# Altium schematic sheet 实验项目三.SchDoc
size A4
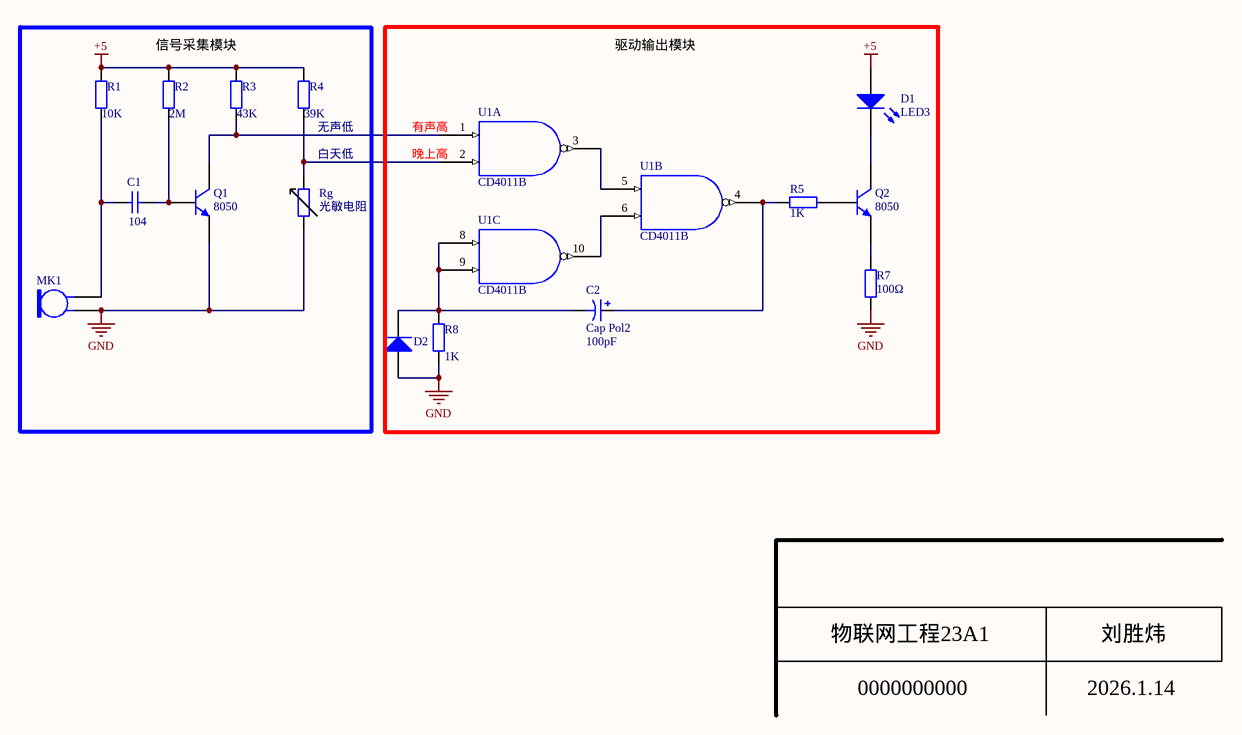
[diagram p0: 实验项目三.SchDoc]

## Parts
C1  value 104  [RAD-0.3]  (hidden comment: Cap)
C2  Cap Pol2  value 100pF  [POLAR0.8]
D1  LED3  [3.5X2.8X1.9]
D2  Diode  [SMC]  (value not drawn)
MK1  Mic2  [PIN2]  (value not drawn)
Q1  8050  [SOT-23B_N]
Q2  8050  [SOT-23B_N]
R1  value 10K  [AXIAL-0.4]  (hidden comment: Res2)
R2  value 2M  [AXIAL-0.4]  (hidden comment: Res2)
R3  value 43K  [AXIAL-0.4]  (hidden comment: Res2)
R4  value 39K  [AXIAL-0.4]  (hidden comment: Res2)
R5  value 1K  [AXIAL-0.4]  (hidden comment: Res2)
R7  value 100Ω  [AXIAL-0.4]  (hidden comment: Res2)
R8  value 1K  [AXIAL-0.4]  (hidden comment: Res2)
Rg  光敏电阻  [AXIAL-0.4]
U1  CD4011B  [DIP-14]  (parts A,B,C of 4)

## Blocks framed on the sheet
信号采集模块: C1 MK1 Q1 R1-R4 Rg
驱动输出模块: C2 D1 D2 Q2 R5 R7 R8 U1

## Nets
+5: D1.1(A) R1.2 R2.2 R3.2 R4.2
GND: D2.1(A) MK1.2 Q1.3(E) R7.2 R8.1 Rg.1 U1.7(GND)
VCC: U1.14(VCC)
NetC1_1: C1.1 MK1.1 R1.1
NetC1_2: C1.2 Q1.2(B) R2.1
NetC2_1: C2.1 R5.2 U1.4
NetC2_2: C2.2 D2.2(K) R8.2 U1.8 U1.9
NetD1_2: D1.2(K) Q2.1(C)
NetQ1_1: Q1.1(C) R3.1 U1.1
NetQ2_2: Q2.2(B) R5.1
NetQ2_3: Q2.3(E) R7.1
NetR4_1: R4.1 Rg.2 U1.2
NetU1_3: U1.3 U1.5
NetU1_6: U1.6 U1.10

## Notes on the sheet
- (near R4) 无声低
- 白天低
- (near U1) 有声高
- (near U1) 晚上高
- 物联网工程23A1
- 0000000000
- 2026.1.14
- 刘胜炜

## Library data of the parts
C1 = Cap: Capacitor; Published: 8-Jun-2000; LatestRevisionDate: 17-Jul-2002; LatestRevisionNote: Re-released for DXP Platform.; PackageReference: RAD-0.3; Publisher: Altium Limited; PackageDescription: Radial Cap, Thru-Hole; 2 Leads; 0.3 in Pin Spacing
C2 = Cap Pol2: Polarized Capacitor (Axial); Published: 8-Jun-2000; LatestRevisionDate: 17-Jul-2002; LatestRevisionNote: Re-released for DXP Platform.; PackageReference: POLAR0.8; Publisher: Altium Limited; PackageDescription: Polarized Capacitor; 2 Leads
D1 = LED3: Typical BLUE SiC LED; Published: 8-Jun-2000; LatestRevisionDate: 17-Dec-2003; LatestRevisionNote: PCB Footprint replaced.; DatasheetVersion: 16-Apr-2002; PackageVersion: 16-Apr-2002; PackageReference: 3.5X2.8X1.9; Publisher: Altium Limited; PackageDescription: SM LED; 2 C-Bend Leads; Body 3.5 x 2.8 x 1.9 mm, inc leads (LxWxH typ)
D2 = Diode: Default Diode; Published: 8-Jun-2000; LatestRevisionDate: 17-Jul-2002; LatestRevisionNote: Re-released for DXP Platform.; PackageVersion: Sep-1996; PackageReference: SMC; Publisher: Altium Limited; PackageDescription: DO-214-AB/SMC; 2 C-Bend Leads; Body 7.9 x 5.9 mm, inc. leads (LxW); Code_JEDEC: DO-214-AB
MK1 = Mic2: Microphone; Published: 24-Mar-1999; LatestRevisionDate: 17-Jul-2002; LatestRevisionNote: Re-released for DXP Platform.; PackageReference: PIN2; Publisher: Altium Limited
Q1 Q2 = QNPN: NPN Bipolar Transistor; Published: 8-Jun-2000; LatestRevisionDate: 29-May-2009; LatestRevisionNote: IPC-7351 Footprint Added.; PackageVersion: Aug-1999; PackageReference: SOT-23B; Publisher: Altium Limited; PackageDescription: 3-Pin SOT-23 Package 0.95 mm Pitch, 2.4 mm Lead Span
R1-R5 R7 R8 = Res2: Resistor; Published: 8-Jun-2000; LatestRevisionDate: 17-Jul-2002; LatestRevisionNote: Re-released for DXP Platform.; PackageReference: AXIAL-0.4; Publisher: Altium Limited; PackageDescription: Axial Device, Thru-Hole; 2 Leads; 0.4 in Pin Spacing
Rg = Rg: Resistor; Value: 1K; Published: 8-Jun-2000; LatestRevisionDate: 17-Jul-2002; LatestRevisionNote: Re-released for DXP Platform.; PackageReference: AXIAL-0.4; Publisher: Altium Limited; PackageDescription: Axial Device, Thru-Hole; 2 Leads; 0.4 in Pin Spacing
U1 = CD4011B: Quad 2-INPUT Nand G